# Altium schematic sheet [04] - REVISION HISTORY.SchDoc
size A
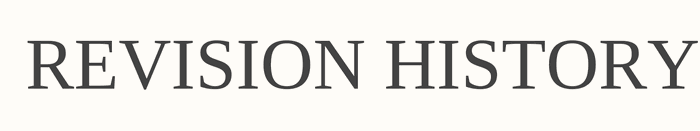
[diagram p0: [04] - REVISION HISTORY.SchDoc]

## Notes on the sheet
- REVISION HISTORY